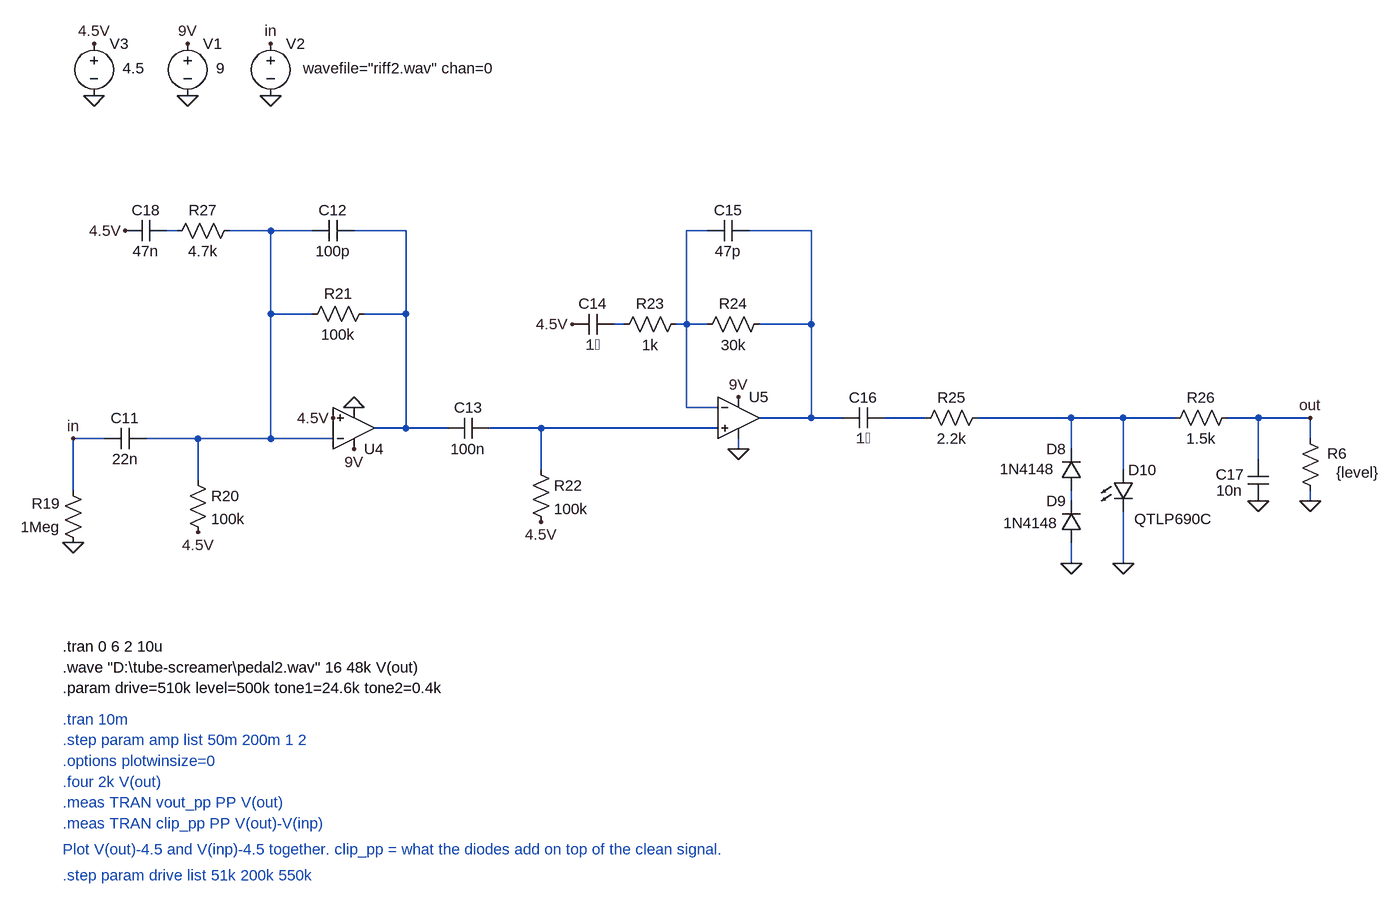
[diagram p0: schematic Clipper2.asc]
Clipper2.asc, the LTspice schematic file:
Version 4.1
SHEET 1 3404 1296
WIRE -192 -320 -208 -320
WIRE -48 -320 -112 -320
WIRE 16 -320 -48 -320
WIRE 160 -320 80 -320
WIRE 624 -320 592 -320
WIRE 784 -320 688 -320
WIRE -48 -192 -48 -320
WIRE 16 -192 -48 -192
WIRE 160 -192 160 -320
WIRE 160 -192 96 -192
WIRE 496 -176 480 -176
WIRE 592 -176 592 -320
WIRE 592 -176 576 -176
WIRE 624 -176 592 -176
WIRE 784 -176 784 -320
WIRE 784 -176 704 -176
WIRE 592 -48 592 -176
WIRE 640 -48 592 -48
WIRE 784 -32 784 -176
WIRE 784 -32 704 -32
WIRE 832 -32 784 -32
WIRE 960 -32 896 -32
WIRE 1184 -32 1040 -32
WIRE 1264 -32 1184 -32
WIRE 1344 -32 1264 -32
WIRE 1472 -32 1424 -32
WIRE 1552 -32 1472 -32
WIRE 160 -16 160 -192
WIRE 160 -16 112 -16
WIRE 224 -16 160 -16
WIRE 368 -16 288 -16
WIRE 640 -16 368 -16
WIRE -304 0 -352 0
WIRE -160 0 -240 0
WIRE -48 0 -48 -192
WIRE -48 0 -160 0
WIRE 48 0 -48 0
WIRE 1552 0 1552 -32
WIRE 672 16 672 0
WIRE 1184 16 1184 -32
WIRE 1472 32 1472 -32
WIRE 368 48 368 -16
WIRE 1264 48 1264 -32
WIRE -160 64 -160 0
WIRE -352 80 -352 0
WIRE 1184 96 1184 80
WIRE 1552 96 1552 80
WIRE 1184 192 1184 160
WIRE 1264 192 1264 112
FLAG -48 -528 0
FLAG -176 -528 0
FLAG -176 -608 9V
FLAG -320 -528 0
FLAG -320 -608 4.5V
FLAG 1552 96 0
FLAG 1552 -32 out
FLAG -48 -608 in
FLAG -352 0 in
FLAG -352 160 0
FLAG -160 144 4.5V
FLAG 80 -48 0
FLAG 80 16 9V
FLAG 368 128 4.5V
FLAG 672 16 0
FLAG 672 -64 9V
FLAG 416 -176 4.5V
FLAG 1184 192 0
FLAG 1472 96 0
FLAG 1264 192 0
FLAG -272 -320 4.5V
FLAG 48 -32 4.5V
SYMBOL voltage -176 -624 R0
WINDOW 3 44 54 Left 2
WINDOW 123 0 0 Left 0
WINDOW 39 0 0 Left 0
SYMATTR Value 9
SYMATTR InstName V1
SYMBOL voltage -48 -624 R0
WINDOW 123 0 0 Left 0
WINDOW 39 0 0 Left 0
WINDOW 3 50 54 Left 2
SYMATTR Value wavefile="riff2.wav" chan=0
SYMATTR InstName V2
SYMBOL voltage -320 -624 R0
WINDOW 3 44 54 Left 2
WINDOW 123 0 0 Left 0
WINDOW 39 0 0 Left 0
SYMATTR Value 4.5
SYMATTR InstName V3
SYMBOL res 1568 96 R180
WINDOW 0 -41 73 Left 2
WINDOW 3 -90 44 Left 2
SYMATTR InstName R6
SYMATTR Value {level}
SYMBOL res -336 176 R180
WINDOW 0 36 76 Left 2
WINDOW 3 36 40 Left 2
SYMATTR InstName R19
SYMATTR Value 1Meg
SYMBOL res -176 48 R0
SYMATTR InstName R20
SYMATTR Value 100k
SYMBOL cap -240 -16 R90
WINDOW 0 0 32 VBottom 2
WINDOW 3 32 32 VTop 2
SYMATTR InstName C11
SYMATTR Value 22n
SYMBOL OpAmps\\UniversalOpAmp2 80 -16 M180
SYMATTR InstName U4
SYMATTR Value2 Avol=1Meg GBW=3Meg Slew=10Meg
SYMBOL res 112 -208 R90
WINDOW 0 0 56 VBottom 2
WINDOW 3 32 56 VTop 2
SYMATTR InstName R21
SYMATTR Value 100k
SYMBOL cap 80 -336 R90
WINDOW 0 0 32 VBottom 2
WINDOW 3 32 32 VTop 2
SYMATTR InstName C12
SYMATTR Value 100p
SYMBOL cap 288 -32 R90
WINDOW 0 0 32 VBottom 2
WINDOW 3 32 32 VTop 2
SYMATTR InstName C13
SYMATTR Value 100n
SYMBOL res 352 32 R0
SYMATTR InstName R22
SYMATTR Value 100k
SYMBOL OpAmps\\UniversalOpAmp2 672 -32 R0
SYMATTR InstName U5
SYMATTR Value2 Avol=1Meg GBW=3Meg Slew=10Meg
SYMBOL res 592 -192 R90
WINDOW 0 0 56 VBottom 2
WINDOW 3 32 56 VTop 2
SYMATTR InstName R23
SYMATTR Value 1k
SYMBOL cap 480 -192 R90
WINDOW 0 0 32 VBottom 2
WINDOW 3 32 32 VTop 2
SYMATTR InstName C14
SYMATTR Value 1�
SYMBOL res 720 -192 R90
WINDOW 0 0 56 VBottom 2
WINDOW 3 32 56 VTop 2
SYMATTR InstName R24
SYMATTR Value 30k
SYMBOL cap 688 -336 R90
WINDOW 0 0 32 VBottom 2
WINDOW 3 32 32 VTop 2
SYMATTR InstName C15
SYMATTR Value 47p
SYMBOL cap 896 -48 R90
WINDOW 0 0 32 VBottom 2
WINDOW 3 32 32 VTop 2
SYMATTR InstName C16
SYMATTR Value 1�
SYMBOL res 1056 -48 R90
WINDOW 0 0 56 VBottom 2
WINDOW 3 32 56 VTop 2
SYMATTR InstName R25
SYMATTR Value 2.2k
SYMBOL diode 1200 80 R180
WINDOW 0 24 64 Left 2
WINDOW 3 41 33 Left 2
SYMATTR InstName D8
SYMATTR Value 1N4148
SYMBOL diode 1200 160 R180
WINDOW 0 24 64 Left 2
WINDOW 3 36 30 Left 2
SYMATTR InstName D9
SYMATTR Value 1N4148
SYMBOL res 1440 -48 R90
WINDOW 0 0 56 VBottom 2
WINDOW 3 32 56 VTop 2
SYMATTR InstName R26
SYMATTR Value 1.5k
SYMBOL cap 1488 96 R180
WINDOW 0 37 41 Left 2
WINDOW 3 40 16 Left 2
SYMATTR InstName C17
SYMATTR Value 10n
SYMBOL LED 1248 48 R0
WINDOW 3 33 76 Left 2
SYMATTR InstName D10
SYMATTR Value QTLP690C
SYMATTR Description Diode
SYMATTR Type diode
SYMBOL res -96 -336 R90
WINDOW 0 0 56 VBottom 2
WINDOW 3 32 56 VTop 2
SYMATTR InstName R27
SYMATTR Value 4.7k
SYMBOL cap -208 -336 R90
WINDOW 0 0 32 VBottom 2
WINDOW 3 32 32 VTop 2
SYMATTR InstName C18
SYMATTR Value 47n
TEXT -368 432 Left 2 ;.tran 10m
TEXT -368 464 Left 2 ;.step param amp list 50m 200m 1 2
TEXT -368 496 Left 2 ;.options plotwinsize=0
TEXT -368 528 Left 2 ;.four 2k V(out)
TEXT -368 560 Left 2 ;.meas TRAN vout_pp PP V(out)
TEXT -368 592 Left 2 ;.meas TRAN clip_pp PP V(out)-V(inp)
TEXT -368 632 Left 2 ;Plot V(out)-4.5 and V(inp)-4.5 together. clip_pp = what the diodes add on top of the clean signal.
TEXT -368 672 Left 2 ;.step param drive list 51k 200k 550k
TEXT -368 320 Left 2 !.tran 0 6 2 10u
TEXT -368 352 Left 2 !.wave "D:\\tube-screamer\\pedal2.wav" 16 48k V(out)
TEXT -368 384 Left 2 !.param drive=510k level=500k tone1=24.6k tone2=0.4k

The netlist it stands for:
* Clipper2.asc
V1 9V 0 9
V2 in 0 wavefile="riff2.wav" chan=0
V3 4.5V 0 4.5
R6 0 out {level}
R19 0 in 1Meg
R20 N002 4.5V 100k
C11 N002 in 22n
X§U4 4.5V N002 9V 0 N003 level2 Avol=1Meg GBW=3Meg Slew=10Meg Ilimit=25m Rail=0 Vos=0 En=0 Enk=0 In=0 Ink=0 Rin=500Meg  ; pins In+ In- V+ V- OUT
R21 N003 N002 100k
C12 N003 N002 100p
C13 N009 N003 100n
R22 N009 4.5V 100k
X§U5 N009 N004 9V 0 N005 level2 Avol=1Meg GBW=3Meg Slew=10Meg Ilimit=25m Rail=0 Vos=0 En=0 Enk=0 In=0 Ink=0 Rin=500Meg  ; pins In+ In- V+ V- OUT
R23 N004 N006 1k
C14 N006 4.5V 1�
R24 N005 N004 30k
C15 N005 N004 47p
C16 N007 N005 1�
R25 N008 N007 2.2k
D8 N010 N008 1N4148
D9 0 N010 1N4148
R26 out N008 1.5k
C17 0 out 10n
D10 N008 0 QTLP690C
R27 N002 N001 4.7k
C18 N001 4.5V 47n
.model D D
.lib standard.dio
* .tran 10m
* .step param amp list 50m 200m 1 2
* .options plotwinsize=0
* .four 2k V(out)
* .meas TRAN vout_pp PP V(out)
* .meas TRAN clip_pp PP V(out)-V(inp)
* Plot V(out)-4.5 and V(inp)-4.5 together. clip_pp = what the diodes add on top of the clean signal.
* .step param drive list 51k 200k 550k
.tran 0 6 2 10u
.wave "D:\tube-screamer\pedal2.wav" 16 48k V(out)
.param drive=510k level=500k tone1=24.6k tone2=0.4k
.lib UniversalOpAmp2.lib
.backanno
.end